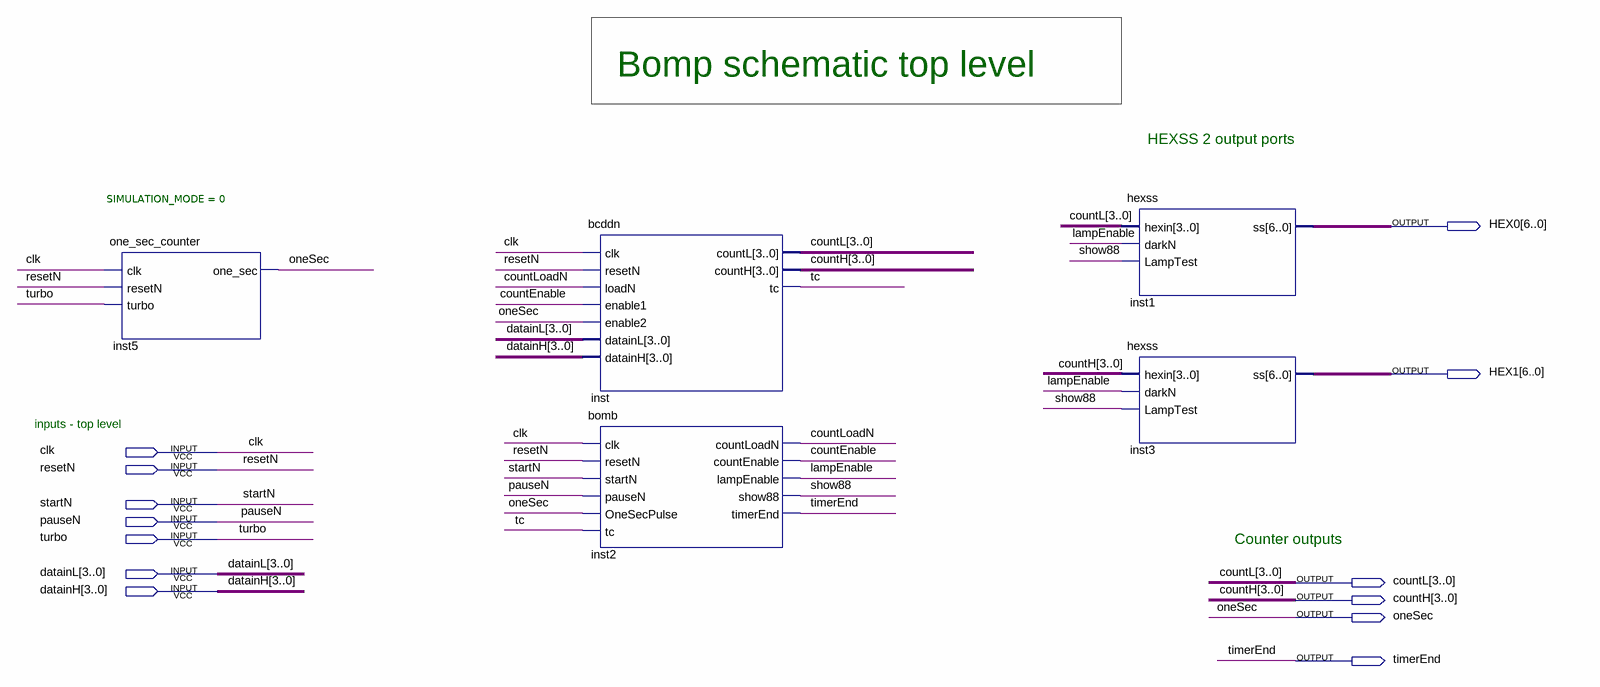
[diagram p0: schematic sheet]
// Quartus schematic topBomb.bdf as structural Verilog: 5 symbols, 13 pins
module topBomb (
  input  clk,
  input  resetN,
  input  startN,
  input  pauseN,
  input  turbo,
  input  [3:0] datainL,
  input  [3:0] datainH,
  output [6:0] HEX0,
  output [6:0] HEX1,
  output [3:0] countL,
  output [3:0] countH,
  output oneSec,
  output timerEnd
);

  wire countEnable, countLoadN, lampEnable, show88, tc;

  one_sec_counter #(.SIMULATION_MODE(0)) inst5 (.clk(clk), .resetN(resetN), .turbo(turbo), .one_sec(oneSec));
  bcddn inst (
    .clk(clk), .resetN(resetN), .loadN(countLoadN), .enable1(countEnable), .enable2(oneSec),
    .datainL(datainL), .datainH(datainH), .countL(countL), .countH(countH), .tc(tc));
  bomb inst2 (
    .clk(clk), .resetN(resetN), .startN(startN), .pauseN(pauseN), .OneSecPulse(oneSec), .tc(tc),
    .countLoadN(countLoadN), .countEnable(countEnable), .lampEnable(lampEnable), .show88(show88),
    .timerEnd(timerEnd));
  hexss inst1 (.hexin(countL), .darkN(lampEnable), .LampTest(show88), .ss(HEX0));
  hexss inst3 (.hexin(countH), .darkN(lampEnable), .LampTest(show88), .ss(HEX1));

  // Notes on the sheet:
  //   Bomp schematic top level  
  //   HEXSS 2 output ports 
  //   inputs - top level
  //   Counter outputs
endmodule
